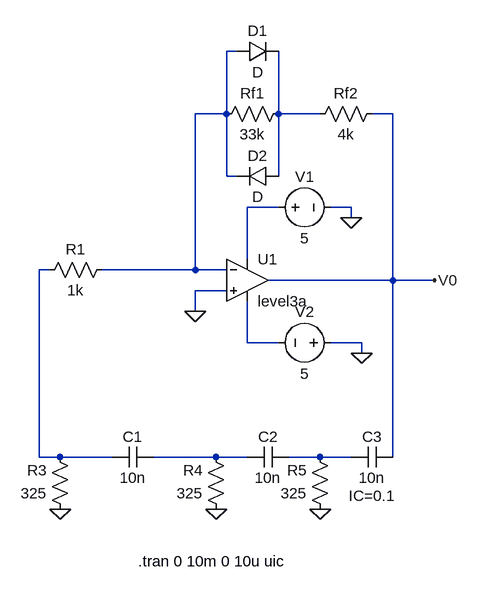
[diagram p0: schematic Draft1.asc]
Draft1.asc, the LTspice schematic file:
Version 4.1
SHEET 1 880 712
WIRE 448 -160 432 -160
WIRE 432 -64 432 -160
WIRE 432 -64 384 -64
WIRE 512 -64 512 -160
WIRE 576 -64 512 -64
WIRE 688 -64 656 -64
WIRE 432 32 432 -64
WIRE 448 32 432 32
WIRE 512 32 512 -64
WIRE 512 80 464 80
WIRE 624 80 592 80
WIRE 624 96 624 80
WIRE 464 160 464 80
WIRE 160 176 144 176
WIRE 384 176 384 -64
WIRE 384 176 240 176
WIRE 432 176 384 176
WIRE 688 192 688 -64
WIRE 688 192 496 192
WIRE 752 192 688 192
WIRE 432 208 384 208
WIRE 384 240 384 208
WIRE 464 288 464 224
WIRE 512 288 464 288
WIRE 640 288 592 288
WIRE 640 304 640 288
WIRE 144 464 144 176
WIRE 176 464 144 464
WIRE 256 464 176 464
WIRE 416 464 320 464
WIRE 464 464 416 464
WIRE 576 464 528 464
WIRE 624 464 576 464
WIRE 688 464 688 192
FLAG 384 240 0
FLAG 176 544 0
FLAG 416 544 0
FLAG 576 544 0
FLAG 640 304 0
FLAG 624 96 0
FLAG 752 192 V0
SYMBOL OpAmps\\UniversalOpAmp3 464 192 R0
SYMATTR InstName U1
SYMBOL res 256 160 R90
WINDOW 0 0 56 VBottom 2
WINDOW 3 32 56 VTop 2
SYMATTR InstName R1
SYMATTR Value 1k
SYMBOL res 528 -80 R90
WINDOW 0 0 56 VBottom 2
WINDOW 3 32 56 VTop 2
SYMATTR InstName Rf1
SYMATTR Value 33k
SYMBOL res 192 560 R180
WINDOW 0 36 76 Left 2
WINDOW 3 36 40 Left 2
SYMATTR InstName R3
SYMATTR Value 325
SYMBOL res 432 560 R180
WINDOW 0 36 76 Left 2
WINDOW 3 36 40 Left 2
SYMATTR InstName R4
SYMATTR Value 325
SYMBOL res 592 560 R180
WINDOW 0 36 76 Left 2
WINDOW 3 36 40 Left 2
SYMATTR InstName R5
SYMATTR Value 325
SYMBOL cap 320 448 R90
WINDOW 0 0 32 VBottom 2
WINDOW 3 32 32 VTop 2
SYMATTR InstName C1
SYMATTR Value 10n
SYMBOL cap 528 448 R90
WINDOW 0 0 32 VBottom 2
WINDOW 3 32 32 VTop 2
SYMATTR InstName C2
SYMATTR Value 10n
SYMBOL cap 688 448 R90
WINDOW 0 0 32 VBottom 2
WINDOW 3 32 32 VTop 2
WINDOW 39 60 32 VTop 2
SYMATTR InstName C3
SYMATTR Value 10n
SYMATTR SpiceLine IC=0.1
SYMBOL voltage 496 80 R270
WINDOW 0 32 56 VTop 2
WINDOW 3 -32 56 VBottom 2
SYMATTR InstName V1
SYMATTR Value 5
SYMBOL voltage 608 288 R90
WINDOW 0 -32 56 VBottom 2
WINDOW 3 32 56 VTop 2
SYMATTR InstName V2
SYMATTR Value 5
SYMBOL diode 448 -144 R270
WINDOW 0 32 32 VTop 2
WINDOW 3 0 32 VBottom 2
SYMATTR InstName D1
SYMBOL diode 512 48 M270
WINDOW 0 32 32 VTop 2
WINDOW 3 0 32 VBottom 2
SYMATTR InstName D2
SYMBOL res 672 -80 R90
WINDOW 0 0 56 VBottom 2
WINDOW 3 32 56 VTop 2
SYMATTR InstName Rf2
SYMATTR Value 4k
TEXT 296 624 Left 2 !.tran 0 10m 0 10u uic

The netlist it stands for:
* Draft1.asc
X§U1 0 N001 N003 N005 V0 level3a  ; pins In+ In- V+ V- OUT
R1 N001 N004 1k
Rf1 N002 N001 33k
R3 0 N004 325
R4 0 N006 325
R5 0 N007 325
C1 N006 N004 10n
C2 N007 N006 10n
C3 V0 N007 10n IC=0.1
V1 N003 0 5
V2 0 N005 5
D1 N001 N002 D
D2 N002 N001 D
Rf2 V0 N002 4k
.model D D
.lib standard.dio
.tran 0 10m 0 10u uic
.backanno
.end